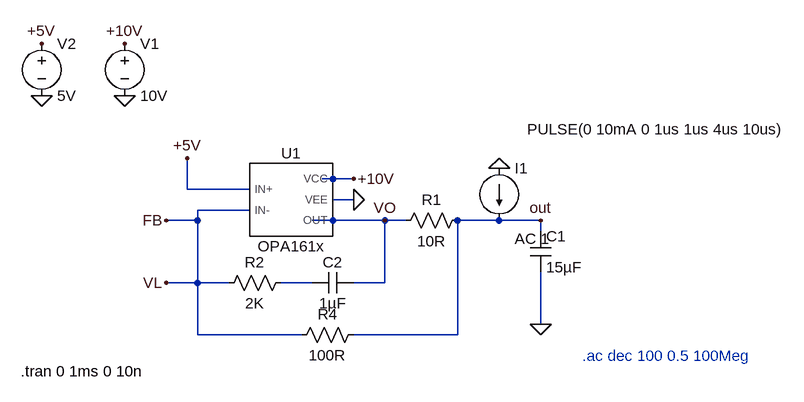
[diagram p0: schematic Draft2.asc]
Draft2.asc, the LTspice schematic file:
Version 4.1
SHEET 1 988 680
WIRE 192 144 176 144
WIRE 224 144 192 144
WIRE -32 160 -32 112
WIRE 64 160 -32 160
WIRE 224 176 192 176
WIRE 64 192 -16 192
WIRE -16 208 -16 192
WIRE -16 208 -64 208
WIRE 192 208 160 208
WIRE 272 208 192 208
WIRE 304 208 272 208
WIRE 448 208 384 208
WIRE 512 208 448 208
WIRE 512 224 512 208
WIRE -16 304 -16 208
WIRE -16 304 -64 304
WIRE 32 304 -16 304
WIRE 160 304 112 304
WIRE 272 304 272 208
WIRE 272 304 224 304
WIRE 512 368 512 288
WIRE -16 384 -16 304
WIRE 144 384 -16 384
WIRE 384 384 384 208
WIRE 384 384 224 384
FLAG -128 16 0
FLAG -256 16 0
FLAG -256 -64 +5V
FLAG -128 -64 +10V
FLAG 224 144 +10V
FLAG 224 176 0
FLAG -32 112 +5V
FLAG 512 368 0
FLAG 512 208 out
FLAG -64 208 FB
FLAG -64 304 VL
FLAG 272 208 VO
FLAG 448 128 0
SYMBOL voltage -128 -80 R0
WINDOW 123 0 0 Left 0
WINDOW 39 0 0 Left 0
SYMATTR InstName V1
SYMATTR Value 10V
SYMBOL voltage -256 -80 R0
WINDOW 123 0 0 Left 0
WINDOW 39 0 0 Left 0
SYMATTR InstName V2
SYMATTR Value 5V
SYMBOL res 400 192 R90
WINDOW 0 0 56 VBottom 2
WINDOW 3 32 56 VTop 2
SYMATTR InstName R1
SYMATTR Value 10R
SYMBOL cap 496 224 R0
SYMATTR InstName C1
SYMATTR Value 15µF
SYMATTR SpiceLine Rser=10m Lser=0.2nH
SYMBOL res 240 368 R90
WINDOW 0 0 56 VBottom 2
WINDOW 3 32 56 VTop 2
SYMATTR InstName R4
SYMATTR Value 100R
SYMBOL cap 224 288 R90
WINDOW 0 0 32 VBottom 2
WINDOW 3 32 32 VTop 2
SYMATTR InstName C2
SYMATTR Value 1µF
SYMBOL res 128 288 R90
WINDOW 0 0 56 VBottom 2
WINDOW 3 32 56 VTop 2
SYMATTR InstName R2
SYMATTR Value 2K
SYMBOL OPA161x 128 176 R0
SYMATTR InstName U1
SYMBOL current 448 128 R0
WINDOW 3 43 -60 Left 2
WINDOW 123 24 108 Left 2
WINDOW 39 0 0 Left 0
SYMATTR Value PULSE(0 10mA 0 1us 1us 4us 10us)
SYMATTR Value2 AC 1
SYMATTR InstName I1
TEXT -288 440 Left 2 !.tran 0 1ms 0 10n
TEXT 576 416 Left 2 ;.ac dec 100 0.5 100Meg

The netlist it stands for:
* Draft2.asc
V1 +10V 0 10V
V2 +5V 0 5V
R1 out VO 10R
C1 out 0 15µF Rser=10m Lser=0.2nH
R4 out VL 100R
C2 VO N001 1µF
R2 N001 VL 2K
X§U1 +5V VL +10V 0 VO OPA161x  ; pins IN+ IN- VCC VEE OUT
I1 0 out PULSE(0 10mA 0 1us 1us 4us 10us) AC 1
.tran 0 1ms 0 10n
* .ac dec 100 0.5 100Meg
.lib OPA161x.LIB
.backanno
.end